# EasyEDA Pro project RK3566_handy_V1.0.epro, schematic RK3566_2, sheets 24 to 25 of 25

## Sheets
24 LPDDR4/4X: Board Name: RK3566主板; Create Date: 2026-10-03; Page Name: LPDDR4/4X; Schematic Name: RK3566; Update Date: 2026-10-03
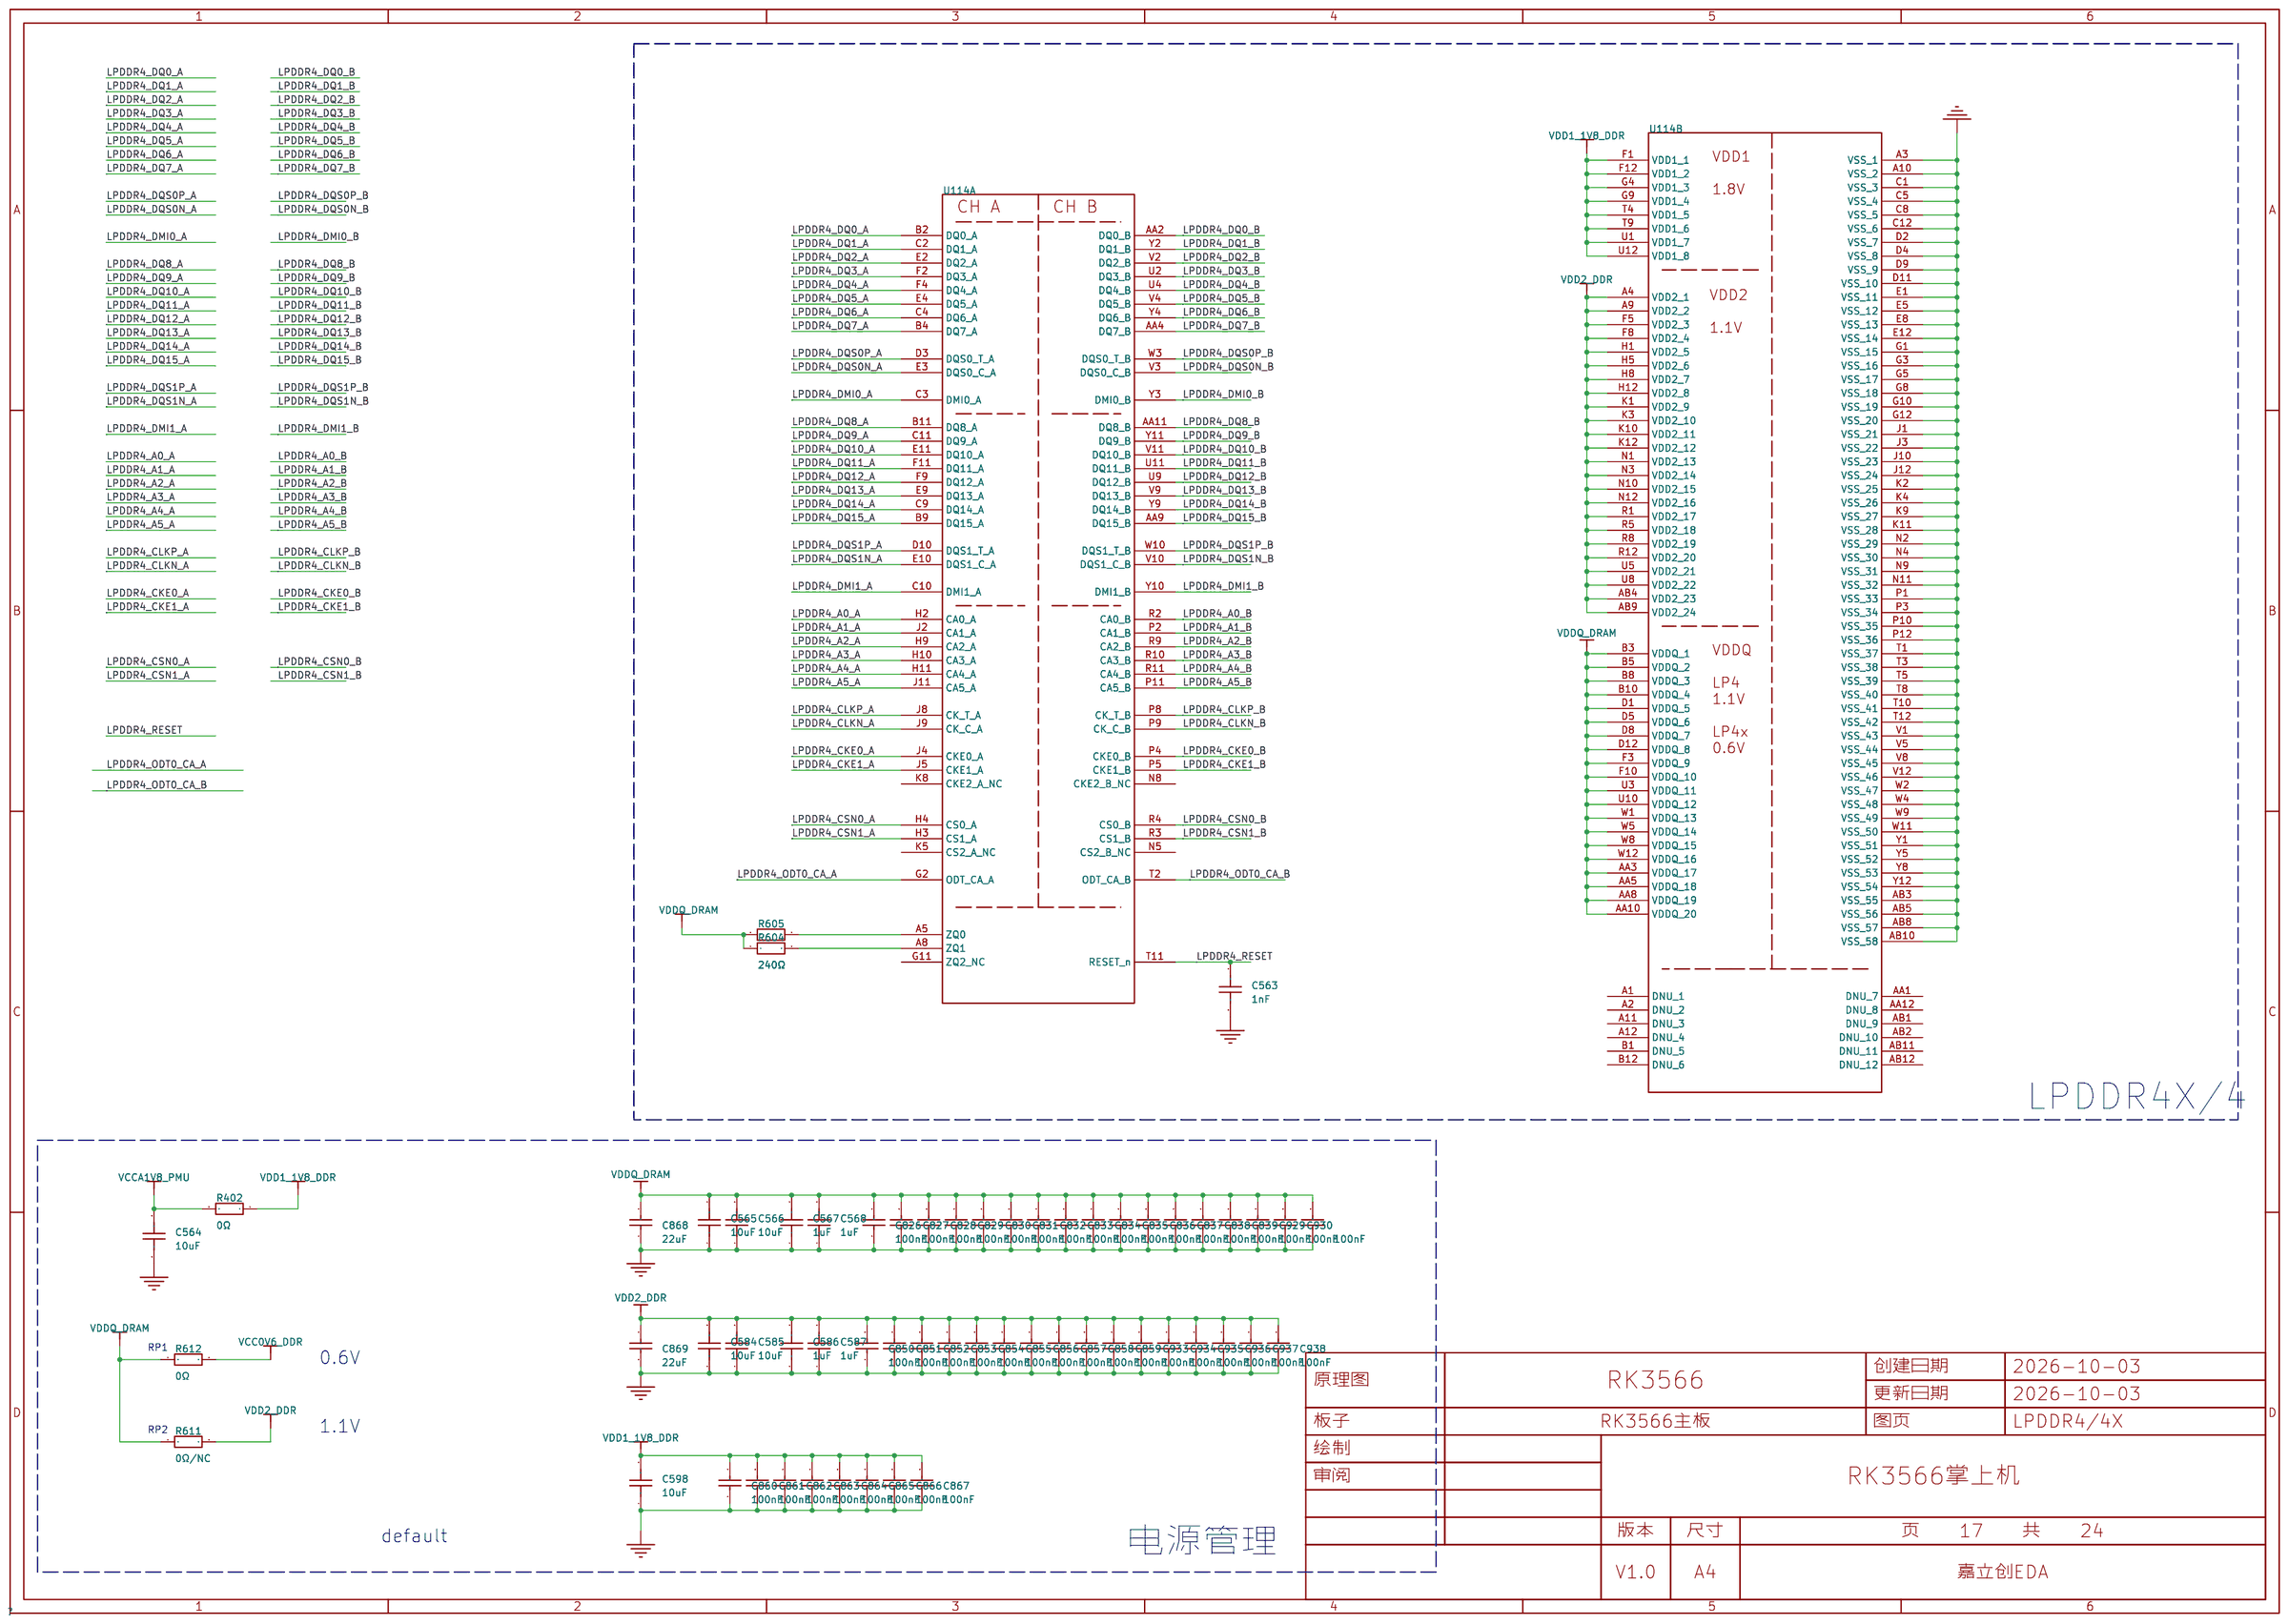
[diagram p23: LPDDR4/4X]
25 EMMC: Create Date: 2026-10-03; Page Name: EMMC; Update Date: 2026-10-03
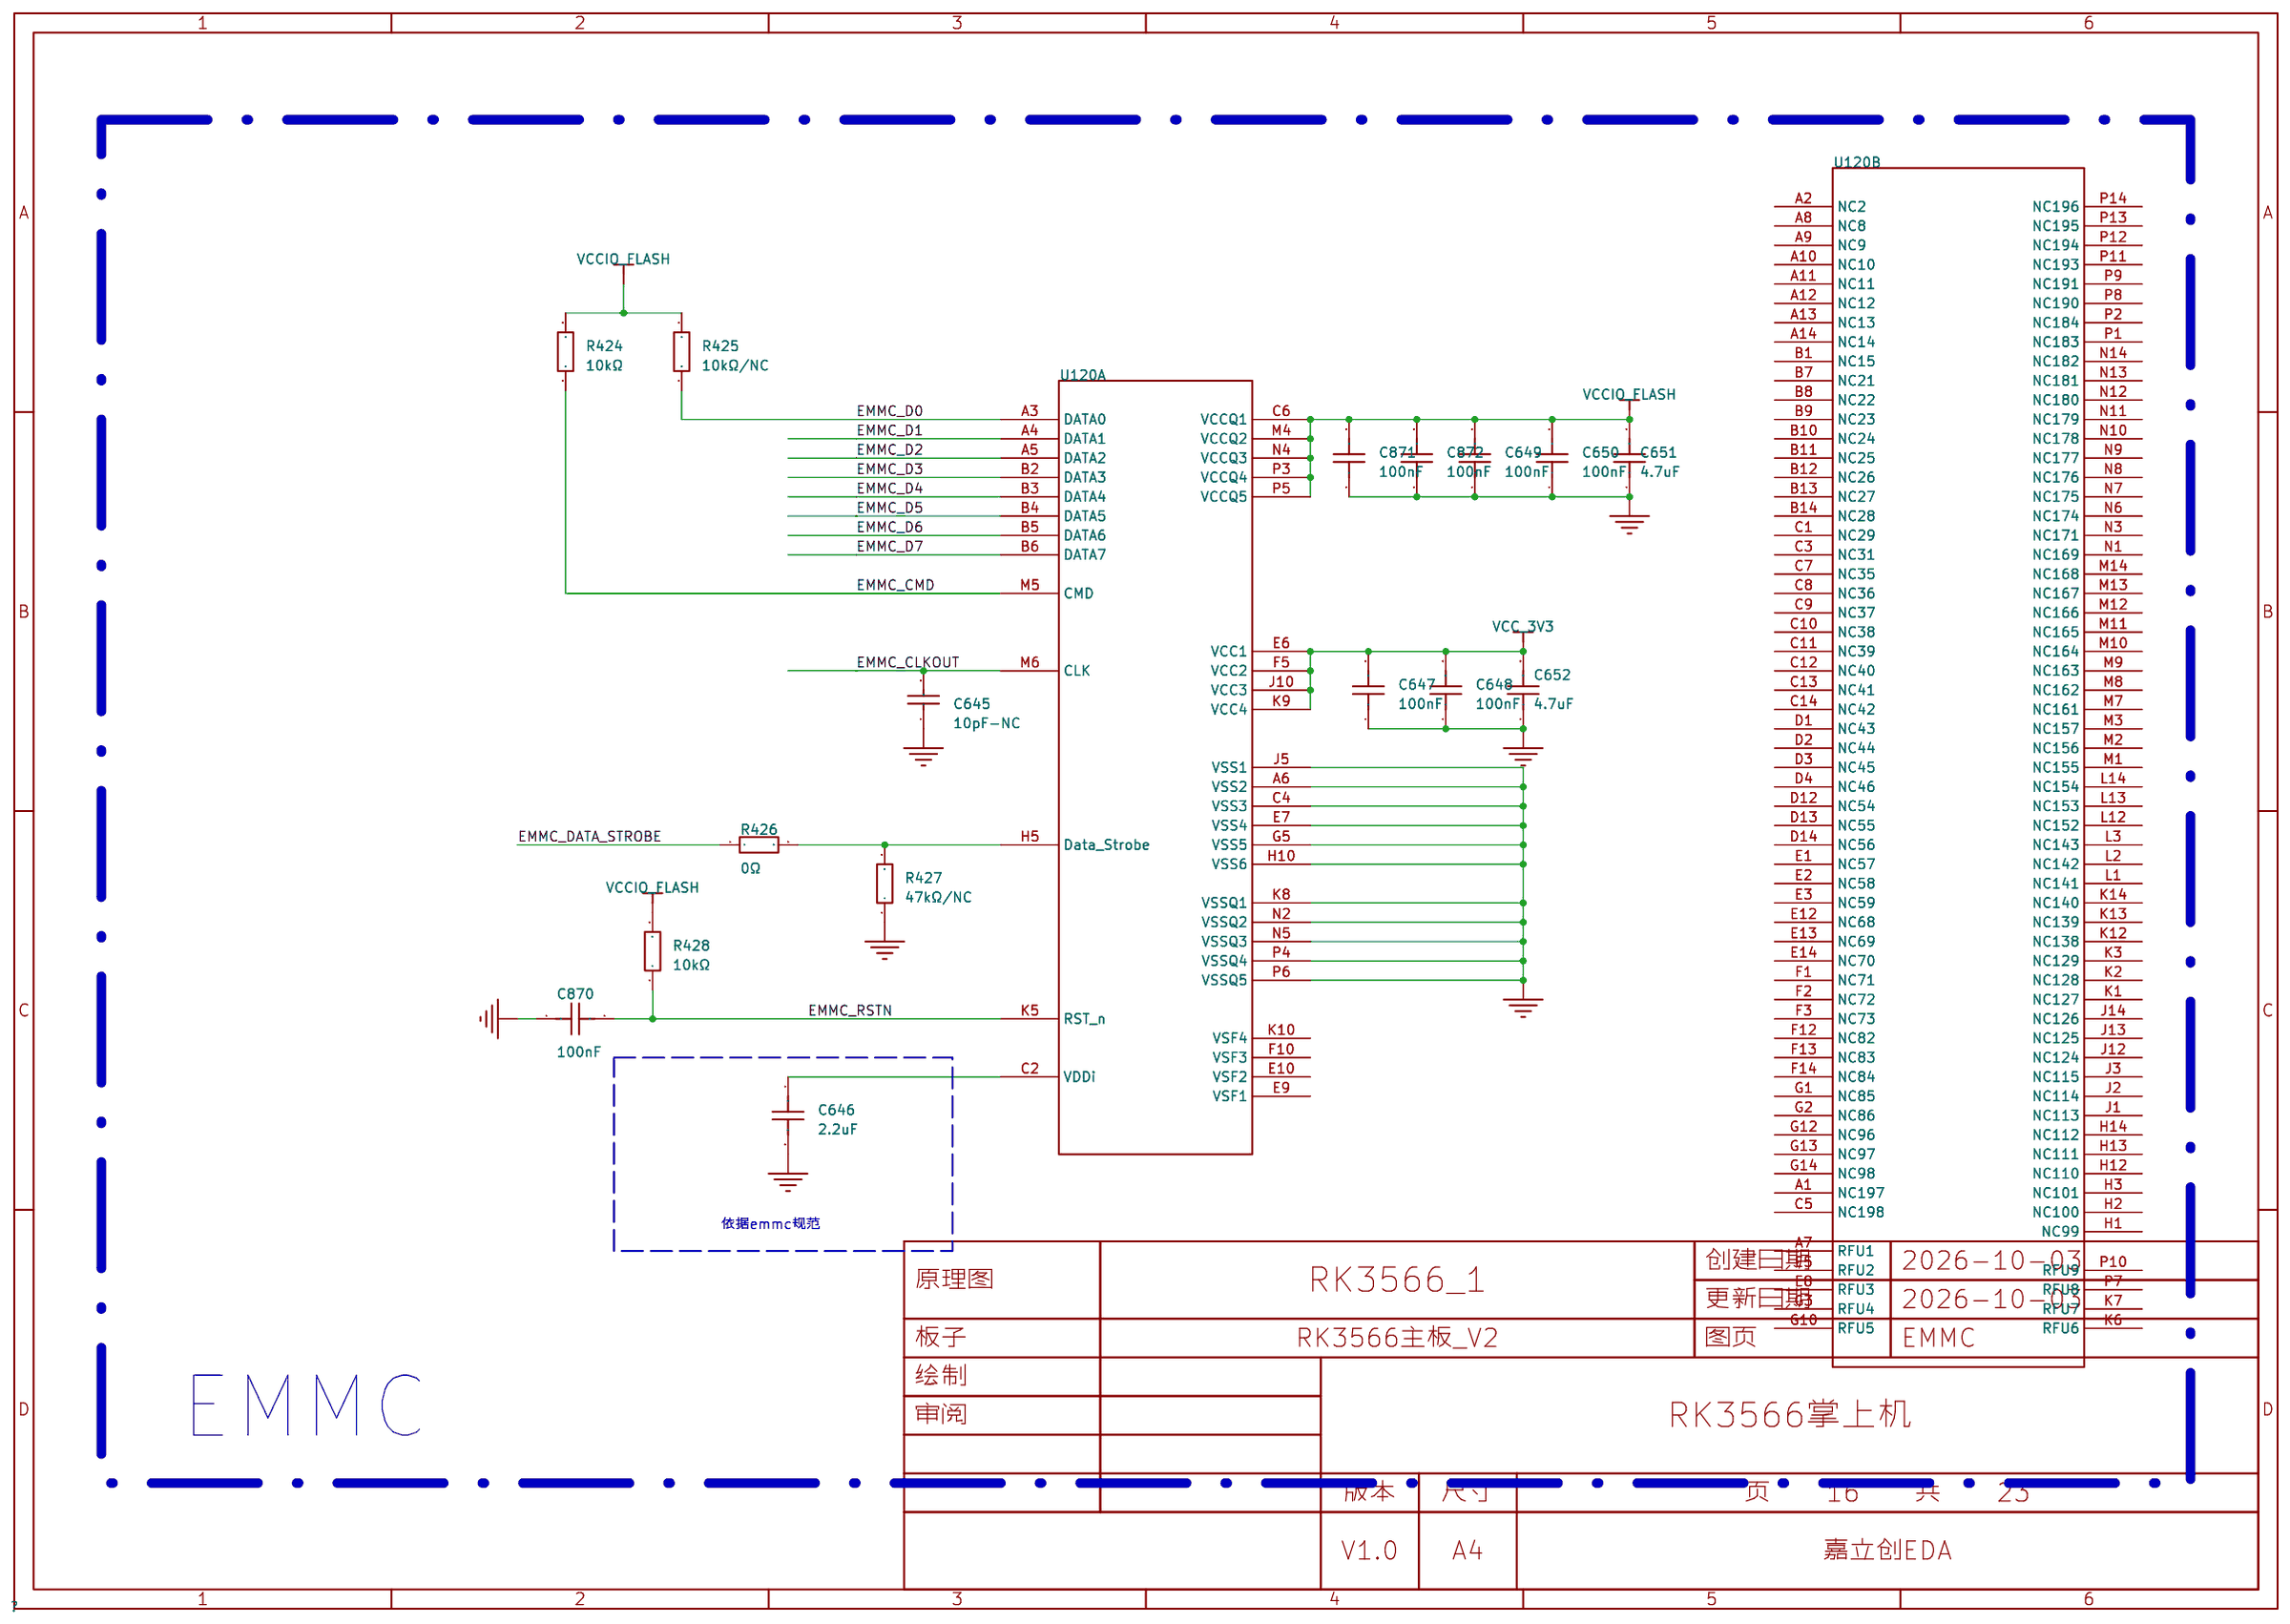
[diagram p24: EMMC]

## Parts
sheet EMMC
C645  10pF-NC  [LL_0402]  (no BOM)
C646  2.2uF  [LL_0402]
C647  100nF  [LL_0402]
C648  100nF  [LL_0402]
C649  100nF  [LL_0402]
C650  100nF  [LL_0402]
C651  4.7uF  [LL_0402]
C652  4.7uF  [LL_0402]
C870  100nF  [LL_0402]
C871  100nF  [LL_0402]
C872  100nF  [LL_0402]
R424  10kΩ  [LL_0402]
R425  10kΩ/NC  [LL_0402]
R426  0Ω  [LL_0402]
R427  47kΩ/NC  [LL_0402]
R428  10kΩ  [LL_0402]
U120  -  [VFBGA-153_L13.0-W11.5-P0.50-BL]  (sections 1,2)
sheet LPDDR4/4X
C563  1nF  [LL_0402]
C564  10uF  [LL_0603]
C565  10uF  [LL_0603]
C566  10uF  [LL_0603]
C567  1uF  [LL_0402]
C568  1uF  [LL_0402]
C584  10uF  [LL_0603]
C585  10uF  [LL_0603]
C586  1uF  [LL_0402]
C587  1uF  [LL_0402]
C598  10uF  [LL_0603]
C826  100nF  [CC_0201]
C827  100nF  [CC_0201]
C828  100nF  [CC_0201]
C829  100nF  [CC_0201]
C830  100nF  [CC_0201]
C831  100nF  [CC_0201]
C832  100nF  [CC_0201]
C833  100nF  [CC_0201]
C834  100nF  [CC_0201]
C835  100nF  [CC_0201]
C836  100nF  [CC_0201]
C837  100nF  [CC_0201]
C838  100nF  [CC_0201]
C839  100nF  [CC_0201]
C850  100nF  [CC_0201]
C851  100nF  [CC_0201]
C852  100nF  [CC_0201]
C853  100nF  [CC_0201]
C854  100nF  [CC_0201]
C855  100nF  [CC_0201]
C856  100nF  [CC_0201]
C857  100nF  [CC_0201]
C858  100nF  [CC_0201]
C859  100nF  [CC_0201]
C860  100nF  [CC_0201]
C861  100nF  [CC_0201]
C862  100nF  [CC_0201]
C863  100nF  [CC_0201]
C864  100nF  [CC_0201]
C865  100nF  [CC_0201]
C866  100nF  [CC_0201]
C867  100nF  [CC_0201]
C868  22uF  [LL_0603]
C869  22uF  [LL_0603]
C929  100nF  [CC_0201]
C930  100nF  [CC_0201]
C931  100nF  [CC_0201]
C933  100nF  [CC_0201]
C934  100nF  [CC_0201]
C935  100nF  [CC_0201]
C936  100nF  [CC_0201]
C937  100nF  [CC_0201]
C938  100nF  [CC_0201]
R402  0Ω  [LL_0402]
R604  240Ω  [RR_0201]
R605  240Ω  [RR_0201]
R611  0Ω/NC  [LL_0402]  (no BOM)
R612  0Ω  [LL_0402]
U114  -  [BGA200_LPDDR4_4X]  (sections 1,2)

## Library data of the parts
C645 = CC0402JRNPO9BN100: 容值:10pF;精度:±5%;额定电压:50V;温度系数:NP0;; LCSC Part Name: 10pF ±5% 50V; Supplier Part: C106199; Manufacturer: YAGEO(国巨); Supplier Footprint: 0402; JLCPCB Part Class: 扩展库; Datasheet: https://item.szlcsc.com/datasheet/CC0402JRNPO9BN100/107414.html; Supplier: LCSC; Tolerance: ±5%; Voltage Rating: 50V; Temperature Coefficient: NP0
C646 = CL05A225KO5NQNC: 容值:2.2uF;精度:±10%;额定电压:16V;温度系数:X5R;; LCSC Part Name: 2.2uF ±10% 16V; Supplier Part: C170151; Manufacturer: SAMSUNG(三星); Supplier Footprint: 0402; JLCPCB Part Class: 扩展库; Datasheet: https://item.szlcsc.com/datasheet/CL05A225KO5NQNC/181536.html; Supplier: LCSC; Tolerance: ±10%; Voltage Rating: 16V; Temperature Coefficient: X5R
C647-C650 C871 C872 = CC0402KRX7R7BB104: 容值:100nF;精度:±10%;额定电压:16V;材质(温度系数):X7R;; LCSC Part Name: 100nF ±10% 16V; Supplier Part: C60474; Manufacturer: YAGEO(国巨); Supplier Footprint: 0402; JLCPCB Part Class: 扩展库; Datasheet: https://atta.szlcsc.com/upload/public/pdf/source/20211223/9278FD768280B81DDBEF48FA36411A03.pdf; Supplier: LCSC; Tolerance: ±10%; Voltage Rated: 16V; Temperature Coefficient: X7R
C651 C652 = CC0402KRX5R6BB475: 容值:4.7uF;精度:±10%;额定电压:10V;温度系数:X5R;; LCSC Part Name: 4.7uF ±10% 10V; Supplier Part: C326586; Manufacturer: YAGEO(国巨); Supplier Footprint: 0402; JLCPCB Part Class: 扩展库; Datasheet: https://item.szlcsc.com/datasheet/CC0402KRX5R6BB475/306680.html; Supplier: LCSC; Tolerance: ±10%; Voltage Rating: 10V; Temperature Coefficient: X5R
C870 = CL05B104KB54PNC: 容值:100nF;精度:±10%;额定电压:50V;温度系数:X7R;; LCSC Part Name: 100nF ±10% 50V; Supplier Part: C307331; Manufacturer: SAMSUNG(三星); Supplier Footprint: 0402; JLCPCB Part Class: 基础库; Datasheet: https://item.szlcsc.com/datasheet/CL05B104KB54PNC/291005.html; Supplier: LCSC; Tolerance: ±10%; Voltage Rating: 50V; Temperature Coefficient: X7R
R424 R425 R428 = RC0402FR-0710KL: 电阻类型:厚膜电阻;阻值:10kΩ;精度:±1%;功率:62.5mW;工作电压:50V;温度系数:±100ppm/℃;; LCSC Part Name: 厚膜电阻 10kΩ ±1% 62.5mW; Supplier Part: C60490; Manufacturer: YAGEO(国巨); Supplier Footprint: 0402; JLCPCB Part Class: 扩展库; Datasheet: https://item.szlcsc.com/datasheet/RC0402FR-0710KL/61542.html; Supplier: LCSC; Type: 厚膜电阻; Tolerance: ±1%; Power(Watts): 62.5mW; Voltage-Supply(Max): 50V; Temperature Coefficient: ±100ppm/℃; Operating Temperature: -55℃~+155℃
R426 = RC0402FR-070RL: 电阻类型:厚膜电阻;阻值:0Ω;精度:±1%;功率:62.5mW;工作电压:50V;温度系数:-;; LCSC Part Name: 厚膜电阻 0Ω ±1% 62.5mW; Supplier Part: C106231; Manufacturer: YAGEO(国巨); Supplier Footprint: 0402; JLCPCB Part Class: 扩展库; Datasheet: https://item.szlcsc.com/datasheet/RC0402FR-070RL/107446.html; Supplier: LCSC; Type: 厚膜电阻; Tolerance: ±1%; Power(Watts): 62.5mW; Voltage-Supply(Max): 50V; Operating Temperature: -55℃~+155℃
R427 = RC0402FR-0747KL: 电阻类型:厚膜电阻;阻值:47kΩ;精度:±1%;功率:62.5mW;最大工作电压:50V;温度系数:±100ppm/℃;; LCSC Part Name: 厚膜电阻 47kΩ ±1% 62.5mW; Supplier Part: C93943; Manufacturer: YAGEO(国巨); Supplier Footprint: 0402; JLCPCB Part Class: 扩展库; Datasheet: https://atta.szlcsc.com/upload/public/pdf/source/20180821/C275644_0D56F95EFF785E7D9A1FEF436B37DA78.pdf; Supplier: LCSC; Type: 厚膜电阻; Tolerance: ±1%; Power(Watts): 62.5mW; Overload Voltage (Max): 50V; Temperature Coefficient: ±100ppm/℃; Operating Temperature Range: -55℃~+155℃
U120 = EMMC_B153_2L
C563 = GRM1555C1H102JA01D: 容值:1nF;精度:±5%;额定电压:50V;材质(温度系数):C0G;; LCSC Part Name: 1nF ±5% 50V; Supplier Part: C76947; Manufacturer: muRata(村田); Supplier Footprint: 0402; JLCPCB Part Class: 扩展库; Datasheet: https://atta.szlcsc.com/upload/public/pdf/source/20180307/C76947_15204091165631407735.pdf; Supplier: LCSC; Tolerance: ±5%; Voltage Rated: 50V; Temperature Coefficient: C0G
C564-C566 C584 C585 C598 = CL10A106MA8NRNC: 容值:10uF;精度:±20%;额定电压:25V;温度系数:X5R;; LCSC Part Name: 10uF ±20% 25V; Supplier Part: C96446; Manufacturer: SAMSUNG(三星); Supplier Footprint: 0603; JLCPCB Part Class: 基础库; Datasheet: https://item.szlcsc.com/datasheet/CL10A106MA8NRNC/97651.html; Supplier: LCSC; Tolerance: ±20%; Voltage Rating: 25V; Temperature Coefficient: X5R
C567 C568 C586 C587 = CL05A105KA5NQNC: 容值:1uF;精度:±10%;额定电压:25V;温度系数:X5R;; LCSC Part Name: 1uF ±10% 25V; Supplier Part: C52923; Manufacturer: SAMSUNG(三星); Supplier Footprint: 0402; JLCPCB Part Class: Basic Part; Datasheet: https://item.szlcsc.com/datasheet/CL05A105KA5NQNC/53938.html; Supplier: LCSC; Tolerance: ±10%; Voltage Rating: 25V; Temperature Coefficient: X5R
C826-C839 C850-C867 C929-C931 C933-C938 = GRM033R61E104KE14D: 容值:100nF;精度:±10%;额定电压:25V;温度系数:X5R;; LCSC Part Name: 100nF ±10% 25V; Supplier Part: C76939; Manufacturer: muRata(村田); Supplier Footprint: 0201; JLCPCB Part Class: 扩展库; Datasheet: https://item.szlcsc.com/datasheet/GRM033R61E104KE14D/78066.html; Supplier: LCSC; Tolerance: ±10%; Voltage Rating: 25V; Temperature Coefficient: X5R
C868 C869 = CC0603MRX5R5BB226: 容值:22uF;精度:±20%;额定电压:6.3V;温度系数:X5R;; LCSC Part Name: 22uF ±20% 6.3V; Supplier Part: C109448; Manufacturer: YAGEO(国巨); Supplier Footprint: 0603; JLCPCB Part Class: 扩展库; Datasheet: https://item.szlcsc.com/datasheet/CC0603MRX5R5BB226/110669.html; Supplier: LCSC; Tolerance: ±20%; Voltage Rating: 6.3V; Temperature Coefficient: X5R
R402 R611 R612 = 0402WGF0000TCE: 电阻类型:厚膜电阻;阻值:0Ω;精度:±1%;功率:62.5mW;; LCSC Part Name: 0Ω ±1% 62.5mW; Supplier Part: C17168; Manufacturer: UNI-ROYAL(厚声); Supplier Footprint: 0402; JLCPCB Part Class: 基础库; Datasheet: https://atta.szlcsc.com/upload/public/pdf/source/20200306/C422600_1E6D84923E4A46A82E41ADD87F860B5C.pdf; Supplier: LCSC; Type: 厚膜电阻; Tolerance: ±1%; Power(Watts): 62.5mW; Temperature Coefficient: ±800ppm/℃; Overload Voltage (Max): 50V; Operating Temperature Range: -55℃~+155℃
R604 R605 = 0201WMF2400TEE: 电阻类型:厚膜电阻;阻值:240Ω;精度:±1%;功率:50mW;工作电压:25V;温度系数:±200ppm/℃;; LCSC Part Name: 240Ω ±1% 50mW 厚膜电阻; Supplier Part: C270354; Manufacturer: UNI-ROYAL(厚声); Supplier Footprint: 0201; JLCPCB Part Class: 扩展库; Datasheet: https://item.szlcsc.com/datasheet/0201WMF2400TEE/259884.html; Supplier: LCSC; Type: 厚膜电阻; Tolerance: ±1%; Power(Watts): 50mW; Voltage-Supply(Max): 25V; Temperature Coefficient: ±200ppm/℃; Operating Temperature: -55℃~+155℃
U114 = BGA_200_LPDDR4_4X

## Nets
GND: C563.1 C564.1 C565.1 C566.1 C567.1 C568.1 C584.1 C585.1 C586.1 C587.1 C598.1 C645.1 C646.2 C647.1 C648.1 C649.1 C650.1 C651.1 C652.1 C826.1 C827.1 C828.1 C829.1 C830.1 C831.1 C832.1 C833.1 C834.1 C835.1 C836.1 C837.1 C838.1 C839.1 C850.1 C851.1 C852.1 C853.1 C854.1 C855.1 C856.1 C857.1 C858.1 C859.1 C860.1 C861.1 C862.1 C863.1 C864.1 C865.1 C866.1 C867.1 C868.1 C869.1 C870.1 C871.1 C872.1 C929.1 C930.1 C931.1 C933.1 C934.1 C935.1 C936.1 C937.1 C938.1 R427.1 U114.A3(VSS_1) U114.A10(VSS_2) U114.AB3(VSS_55) U114.AB5(VSS_56) U114.AB8(VSS_57) U114.AB10(VSS_58) U114.C1(VSS_3) U114.C5(VSS_4) U114.C8(VSS_5) U114.C12(VSS_6) U114.D2(VSS_7) U114.D4(VSS_8) U114.D9(VSS_9) U114.D11(VSS_10) U114.E1(VSS_11) U114.E5(VSS_12) U114.E8(VSS_13) U114.E12(VSS_14) U114.G1(VSS_15) U114.G3(VSS_16) U114.G5(VSS_17) U114.G8(VSS_18) U114.G10(VSS_19) U114.G12(VSS_20) U114.J1(VSS_21) U114.J3(VSS_22) U114.J10(VSS_23) U114.J12(VSS_24) U114.K2(VSS_25) U114.K4(VSS_26) U114.K9(VSS_27) U114.K11(VSS_28) U114.N2(VSS_29) U114.N4(VSS_30) U114.N9(VSS_31) U114.N11(VSS_32) U114.P1(VSS_33) U114.P3(VSS_34) U114.P10(VSS_35) U114.P12(VSS_36) U114.T1(VSS_37) U114.T3(VSS_38) U114.T5(VSS_39) U114.T8(VSS_40) U114.T10(VSS_41) U114.T12(VSS_42) U114.V1(VSS_43) U114.V5(VSS_44) U114.V8(VSS_45) U114.V12(VSS_46) U114.W2(VSS_47) U114.W4(VSS_48) U114.W9(VSS_49) U114.W11(VSS_50) U114.Y1(VSS_51) U114.Y5(VSS_52) U114.Y8(VSS_53) U114.Y12(VSS_54) U120.A6(VSS2) U120.C4(VSS3) U120.E7(VSS4) U120.G5(VSS5) U120.H10(VSS6) U120.J5(VSS1) U120.K8(VSSQ1) U120.N2(VSSQ2) U120.N5(VSSQ3) U120.P4(VSSQ4) U120.P6(VSSQ5) ; also on sheet 1 2 3 4 5 6 7 8 9 10 11 12 13 14 15 16 17 18 19 20 21 22 23
VCC0V6_DDR: R612.2 ; also on sheet 21
VCC_3V3: C647.2 C648.2 C652.2 U120.E6(VCC1) U120.F5(VCC2) U120.J10(VCC3) U120.K9(VCC4) ; also on sheet 7 8 13 15 16 17 21 22
VCCA1V8_PMU: C564.2 R402.2 ; also on sheet 14 22
VCCIO_FLASH: C649.2 C650.2 C651.2 C871.2 C872.2 R424.2 R425.2 R428.2 U120.C6(VCCQ1) U120.M4(VCCQ2) U120.N4(VCCQ3) U120.P3(VCCQ4) U120.P5(VCCQ5) ; also on sheet 3 21
VDD1_1V8_DDR: C598.2 C860.2 C861.2 C862.2 C863.2 C864.2 C865.2 C866.2 C867.2 R402.1 U114.F1(VDD1_1) U114.F12(VDD1_2) U114.G4(VDD1_3) U114.G9(VDD1_4) U114.T4(VDD1_5) U114.T9(VDD1_6) U114.U1(VDD1_7) U114.U12(VDD1_8) ; also on sheet 21
VDD2_DDR: C584.2 C585.2 C586.2 C587.2 C850.2 C851.2 C852.2 C853.2 C854.2 C855.2 C856.2 C857.2 C858.2 C859.2 C869.2 C933.2 C934.2 C935.2 C936.2 C937.2 C938.2 R611.2 U114.A4(VDD2_1) U114.A9(VDD2_2) U114.AB4(VDD2_23) U114.AB9(VDD2_24) U114.F5(VDD2_3) U114.F8(VDD2_4) U114.H1(VDD2_5) U114.H5(VDD2_6) U114.H8(VDD2_7) U114.H12(VDD2_8) U114.K1(VDD2_9) U114.K3(VDD2_10) U114.K10(VDD2_11) U114.K12(VDD2_12) U114.N1(VDD2_13) U114.N3(VDD2_14) U114.N10(VDD2_15) U114.N12(VDD2_16) U114.R1(VDD2_17) U114.R5(VDD2_18) U114.R8(VDD2_19) U114.R12(VDD2_20) U114.U5(VDD2_21) U114.U8(VDD2_22) ; also on sheet 2 22
VDDQ_DRAM: C565.2 C566.2 C567.2 C568.2 C826.2 C827.2 C828.2 C829.2 C830.2 C831.2 C832.2 C833.2 C834.2 C835.2 C836.2 C837.2 C838.2 C839.2 C868.2 C929.2 C930.2 C931.2 R604.1 R605.1 R611.1 R612.1 U114.AA3(VDDQ_17) U114.AA5(VDDQ_18) U114.AA8(VDDQ_19) U114.AA10(VDDQ_20) U114.B3(VDDQ_1) U114.B5(VDDQ_2) U114.B8(VDDQ_3) U114.B10(VDDQ_4) U114.D1(VDDQ_5) U114.D5(VDDQ_6) U114.D8(VDDQ_7) U114.D12(VDDQ_8) U114.F3(VDDQ_9) U114.F10(VDDQ_10) U114.U3(VDDQ_11) U114.U10(VDDQ_12) U114.W1(VDDQ_13) U114.W5(VDDQ_14) U114.W8(VDDQ_15) U114.W12(VDDQ_16) ; also on sheet 2
EMMC_CLKOUT: C645.2 U120.M6(CLK) ; also on sheet 3
EMMC_CMD: R424.1 U120.M5(CMD) ; also on sheet 3
EMMC_D0: R425.1 U120.A3(DATA0) ; also on sheet 3 19
EMMC_D1: U120.A4(DATA1) ; also on sheet 3
EMMC_D2: U120.A5(DATA2) ; also on sheet 3
EMMC_D3: U120.B2(DATA3) ; also on sheet 3
EMMC_D4: U120.B3(DATA4) ; also on sheet 3
EMMC_D5: U120.B4(DATA5) ; also on sheet 3
EMMC_D6: U120.B5(DATA6) ; also on sheet 3
EMMC_D7: U120.B6(DATA7) ; also on sheet 3
EMMC_DATA_STROBE: R426.1 ; also on sheet 3
EMMC_RSTN: C870.2 R428.1 U120.K5(RST_n) ; also on sheet 3
LPDDR4_A0_A: U114.H2(CA0_A) ; also on sheet 2
LPDDR4_A0_B: U114.R2(CA0_B) ; also on sheet 2
LPDDR4_A1_A: U114.J2(CA1_A) ; also on sheet 2
LPDDR4_A1_B: U114.P2(CA1_B) ; also on sheet 2
LPDDR4_A2_A: U114.H9(CA2_A) ; also on sheet 2
LPDDR4_A2_B: U114.R9(CA2_B) ; also on sheet 2
LPDDR4_A3_A: U114.H10(CA3_A) ; also on sheet 2
LPDDR4_A3_B: U114.R10(CA3_B) ; also on sheet 2
LPDDR4_A4_A: U114.H11(CA4_A) ; also on sheet 2
LPDDR4_A4_B: U114.R11(CA4_B) ; also on sheet 2
LPDDR4_A5_A: U114.J11(CA5_A) ; also on sheet 2
LPDDR4_A5_B: U114.P11(CA5_B) ; also on sheet 2
LPDDR4_CKE0_A: U114.J4(CKE0_A) ; also on sheet 2
LPDDR4_CKE0_B: U114.P4(CKE0_B) ; also on sheet 2
LPDDR4_CKE1_A: U114.J5(CKE1_A) ; also on sheet 2
LPDDR4_CKE1_B: U114.P5(CKE1_B) ; also on sheet 2
LPDDR4_CLKN_A: U114.J9(CK_C_A) ; also on sheet 2
LPDDR4_CLKN_B: U114.P9(CK_C_B) ; also on sheet 2
LPDDR4_CLKP_A: U114.J8(CK_T_A) ; also on sheet 2
LPDDR4_CLKP_B: U114.P8(CK_T_B) ; also on sheet 2
LPDDR4_CSN0_A: U114.H4(CS0_A) ; also on sheet 2
LPDDR4_CSN0_B: U114.R4(CS0_B) ; also on sheet 2
LPDDR4_CSN1_A: U114.H3(CS1_A) ; also on sheet 2
LPDDR4_CSN1_B: U114.R3(CS1_B) ; also on sheet 2
LPDDR4_DMI0_A: U114.C3(DMI0_A) ; also on sheet 2
LPDDR4_DMI0_B: U114.Y3(DMI0_B) ; also on sheet 2
LPDDR4_DMI1_A: U114.C10(DMI1_A) ; also on sheet 2
LPDDR4_DMI1_B: U114.Y10(DMI1_B) ; also on sheet 2
LPDDR4_DQ0_A: U114.B2(DQ0_A) ; also on sheet 2
LPDDR4_DQ0_B: U114.AA2(DQ0_B) ; also on sheet 2
LPDDR4_DQ1_A: U114.C2(DQ1_A) ; also on sheet 2
LPDDR4_DQ1_B: U114.Y2(DQ1_B) ; also on sheet 2
LPDDR4_DQ2_A: U114.E2(DQ2_A) ; also on sheet 2
LPDDR4_DQ2_B: U114.V2(DQ2_B) ; also on sheet 2
LPDDR4_DQ3_A: U114.F2(DQ3_A) ; also on sheet 2
LPDDR4_DQ3_B: U114.U2(DQ3_B) ; also on sheet 2
LPDDR4_DQ4_A: U114.F4(DQ4_A) ; also on sheet 2
LPDDR4_DQ4_B: U114.U4(DQ4_B) ; also on sheet 2
LPDDR4_DQ5_A: U114.E4(DQ5_A) ; also on sheet 2
LPDDR4_DQ5_B: U114.V4(DQ5_B) ; also on sheet 2
LPDDR4_DQ6_A: U114.C4(DQ6_A) ; also on sheet 2
LPDDR4_DQ6_B: U114.Y4(DQ6_B) ; also on sheet 2
LPDDR4_DQ7_A: U114.B4(DQ7_A) ; also on sheet 2
LPDDR4_DQ7_B: U114.AA4(DQ7_B) ; also on sheet 2
LPDDR4_DQ8_A: U114.B11(DQ8_A) ; also on sheet 2
LPDDR4_DQ8_B: U114.AA11(DQ8_B) ; also on sheet 2
LPDDR4_DQ9_A: U114.C11(DQ9_A) ; also on sheet 2
LPDDR4_DQ9_B: U114.Y11(DQ9_B) ; also on sheet 2
LPDDR4_DQ10_A: U114.E11(DQ10_A) ; also on sheet 2
LPDDR4_DQ10_B: U114.V11(DQ10_B) ; also on sheet 2
LPDDR4_DQ11_A: U114.F11(DQ11_A) ; also on sheet 2
LPDDR4_DQ11_B: U114.U11(DQ11_B) ; also on sheet 2
LPDDR4_DQ12_A: U114.F9(DQ12_A) ; also on sheet 2
LPDDR4_DQ12_B: U114.U9(DQ12_B) ; also on sheet 2
LPDDR4_DQ13_A: U114.E9(DQ13_A) ; also on sheet 2
LPDDR4_DQ13_B: U114.V9(DQ13_B) ; also on sheet 2
LPDDR4_DQ14_A: U114.C9(DQ14_A) ; also on sheet 2
LPDDR4_DQ14_B: U114.Y9(DQ14_B) ; also on sheet 2
LPDDR4_DQ15_A: U114.B9(DQ15_A) ; also on sheet 2
LPDDR4_DQ15_B: U114.AA9(DQ15_B) ; also on sheet 2
LPDDR4_DQS0N_A: U114.E3(DQS0_C_A) ; also on sheet 2
LPDDR4_DQS0N_B: U114.V3(DQS0_C_B) ; also on sheet 2
LPDDR4_DQS0P_A: U114.D3(DQS0_T_A) ; also on sheet 2
LPDDR4_DQS0P_B: U114.W3(DQS0_T_B) ; also on sheet 2
LPDDR4_DQS1N_A: U114.E10(DQS1_C_A) ; also on sheet 2
LPDDR4_DQS1N_B: U114.V10(DQS1_C_B) ; also on sheet 2
LPDDR4_DQS1P_A: U114.D10(DQS1_T_A) ; also on sheet 2
LPDDR4_DQS1P_B: U114.W10(DQS1_T_B) ; also on sheet 2
LPDDR4_ODT0_CA_A: U114.G2(ODT_CA_A) ; also on sheet 2
LPDDR4_ODT0_CA_B: U114.T2(ODT_CA_B) ; also on sheet 2
LPDDR4_RESET: C563.2 U114.T11(RESET_n) ; also on sheet 2
$15N6680: R605.2 U114.A5(ZQ0)
$15N6681: R604.2 U114.A8(ZQ1)
$16N2863: C646.1 U120.C2(VDDi)
$16N2867: R426.2 R427.2 U120.H5(Data Strobe)

Not connected (* = marked no-connect by the designer): U114 A1(DNU_1) A2(DNU_2) A11(DNU_3) A12(DNU_4) AA1(DNU_7) AA12(DNU_8) AB1(DNU_9) AB2(DNU_10) AB11(DNU_11) AB12(DNU_12) B1(DNU_5) B12(DNU_6) G11(ZQ2_NC) K5(CS2_A_NC) K8(CKE2_A_NC) N5(CS2_B_NC) N8(CKE2_B_NC); U120 A1(NC197) A2(NC2) A7(RFU1) A8(NC8) A9(NC9) A10(NC10) A11(NC11) A12(NC12) A13(NC13) A14(NC14) B1(NC15) B7(NC21) B8(NC22) B9(NC23) B10(NC24) B11(NC25) B12(NC26) B13(NC27) B14(NC28) C1(NC29) C3(NC31) C5(NC198) C7(NC35) C8(NC36) C9(NC37) C10(NC38) C11(NC39) C12(NC40) C13(NC41) C14(NC42) D1(NC43) D2(NC44) D3(NC45) D4(NC46) D12(NC54) D13(NC55) D14(NC56) E1(NC57) E2(NC58) E3(NC59) E5(RFU2) E8(RFU3) E9(VSF1) E10(VSF2) E12(NC68) E13(NC69) E14(NC70) F1(NC71) F2(NC72) F3(NC73) F10(VSF3) F12(NC82) F13(NC83) F14(NC84) G1(NC85) G2(NC86) G3(RFU4) G10(RFU5) G12(NC96) G13(NC97) G14(NC98) H1(NC99) H2(NC100) H3(NC101) H12(NC110) H13(NC111) H14(NC112) J1(NC113) J2(NC114) J3(NC115) J12(NC124) J13(NC125) J14(NC126) K1(NC127) K2(NC128) K3(NC129) K6(RFU6) K7(RFU7) K10(VSF4) K12(NC138) K13(NC139) K14(NC140) L1(NC141) L2(NC142) L3(NC143) L12(NC152) L13(NC153) L14(NC154) M1(NC155) M2(NC156) M3(NC157) M7(NC161) M8(NC162) M9(NC163) M10(NC164) M11(NC165) M12(NC166) M13(NC167) M14(NC168) N1(NC169) N3(NC171) N6(NC174) N7(NC175) N8(NC176) N9(NC177) N10(NC178) N11(NC179) N12(NC180) N13(NC181) N14(NC182) P1(NC183) P2(NC184) P7(RFU8) P8(NC190) P9(NC191) P10(RFU9) P11(NC193) P12(NC194) P13(NC195) P14(NC196)

## Notes on the sheets
sheet 24
- LPDDR4X/4
- RP1
- 0.6V
- RP2
- 1.1V
- default
- 电源管理
sheet 25
- 依据emmc规范
- EMMC
